# Altium schematic sheet Bluetooth.SchDoc
size A; Author: Jared Ainsworth; CompanyName: UpRev LLC; Engineer: Jared Ainsworth; Organization: UpRev LLC; Address1: 4807 Commercial Park Dr.; Address2: Austin, TX 78724; Address3: United States; Address4: www.UpRev.com; SheetNumber: 4; SheetTotal: 13
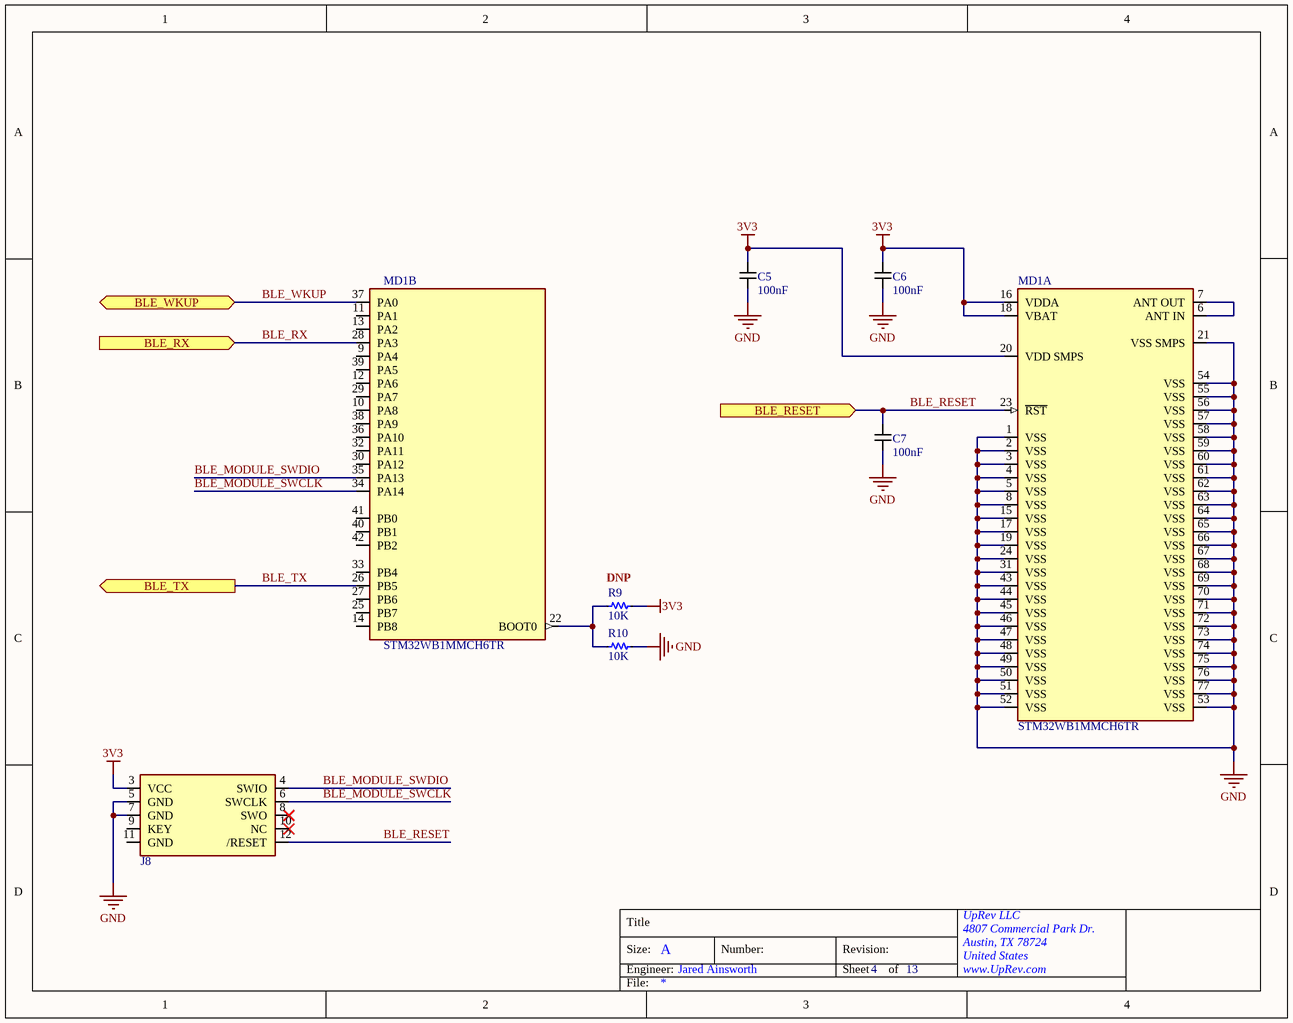
[diagram p0: Bluetooth.SchDoc]

## Parts
C5  100nF  [C0402 (1005)]
C6  100nF  [C0402 (1005)]
C7  100nF  [C0402 (1005)]
J8  JTAG 14 Pos Header 1.27mm Pitch (.5") (ST Micro)  [Connector 14 Pos Samtec SHF-107-01-L-D-SM]  (value not drawn)
MD1  STM32WB1MMCH6TR  [LGA-77]  (parts A,B of 2)
R9  10K  [R0402 (1005)]  (no BOM)
R10  10K  [R0402 (1005)]

## Ports
BLE_RESET (in, see Top_Level[2D], Dev_Board_Connection[3B]), BLE_RX (in, see Top_Level[2D], Dev_Board_Connection[2B]), BLE_TX (out, see Top_Level[2D], Dev_Board_Connection[2B]), BLE_WKUP (bidir, see Top_Level[2D], Dev_Board_Connection[2B])

## Nets
3V3: C5.1 C6.1 J8.3(VCC) MD1.16(VDDA) MD1.18(VBAT) MD1.20(VDD_SMPS) R9.2
GND: C5.2 C6.2 C7.2 J8.5(GND) J8.7(GND) MD1.1(VSS) MD1.2(VSS) MD1.3(VSS) MD1.4(VSS) MD1.5(VSS) MD1.8(VSS) MD1.15(VSS) MD1.17(VSS) MD1.19(VSS) MD1.21(VSS_SMPS) MD1.24(VSS) MD1.31(VSS) MD1.43(VSS) MD1.44(VSS) MD1.45(VSS) MD1.46(VSS) MD1.47(VSS) MD1.48(VSS) MD1.49(VSS) MD1.50(VSS) MD1.51(VSS) MD1.52(VSS) MD1.53(VSS) MD1.54(VSS) MD1.55(VSS) MD1.56(VSS) MD1.57(VSS) MD1.58(VSS) MD1.59(VSS) MD1.60(VSS) MD1.61(VSS) MD1.62(VSS) MD1.63(VSS) MD1.64(VSS) MD1.65(VSS) MD1.66(VSS) MD1.67(VSS) MD1.68(VSS) MD1.69(VSS) MD1.70(VSS) MD1.71(VSS) MD1.72(VSS) MD1.73(VSS) MD1.74(VSS) MD1.75(VSS) MD1.76(VSS) MD1.77(VSS) R10.2
BLE_MODULE_SWCLK: J8.6(SWCLK) MD1.34(PA14)
BLE_MODULE_SWDIO: J8.4(SWIO) MD1.35(PA13)
BLE_RESET: C7.1 J8.12(/RESET) MD1.23(~{RST}) ; port BLE_RESET
BLE_RX: MD1.28(PA3) ; port BLE_RX
BLE_TX: MD1.26(PB5) ; port BLE_TX
BLE_WKUP: MD1.37(PA0) ; port BLE_WKUP
NetMD1_6: MD1.6(ANT_IN) MD1.7(ANT_OUT)
NetMD1_22: MD1.22(BOOT0) R9.1 R10.1

Not connected (* = marked no-connect by the designer): J8 8(SWO)* 9(KEY) 10(NC)* 11(GND); MD1 9(PA4) 10(PA8) 11(PA1) 12(PA6) 13(PA2) 14(PB8) 25(PB7) 27(PB6) 29(PA7) 30(PA12) 32(PA11) 33(PB4) 36(PA10) 38(PA9) 39(PA5) 40(PB1) 41(PB0) 42(PB2)

## Notes on the sheet
- (near R9) DNP
- Title
- Size:
- Engineer:
- A
- Number:
- Revision:
- Sheet
- of
- File:

## Library data of the parts
C5-C7 = 100nF Ceramic, 16V, 0402 (1005): 100nF Ceramic Capacitor, 16V, X7R, ±10%, 0402 (1005); Manufacturer Part Number: CL05B104KO5NNNC; Manufacturer: Samsung Electro-Mechanics; Package: 0402 (1005 metric); LCSC Part Number: C1525; Value: 100nF
J8 = JTAG 14 Pos Header 1.27mm Pitch (.5") (ST Micro): JTAG 14 Pos Header, 1.27mm Pitch, (.5"), (ST Micro); Manufacturer: Samtec; Manufacturer Part Number: SHF-107-01-L-D-SM-LC; LCSC Part Number: C17540447; Package: SMD
MD1 = STM32WB1MMCH6TR: Bluetooth Low Energy Module; Manufacturer: STMicroelectronics; LCSC Part Number: C5456183; Package: LGA-77(6.5x10); Manufacturer Part Number: STM32WB1MMCH6TR
R9 R10 = 10K ohm, 0402 (1005): 10K ohm, Resistor, ±1%, 0402 (1005); Manufacturer: Ever Ohms Tech; Manufacturer Part Number: CR0402F10K0Q10Z; Power: 100mW; Package: 0402 (1005 metric); LCSC Part Number: C881209; Value: 10K